# Altium schematic sheet Temperature_Sensor_Schematic.SchDoc
size A; SheetNumber: 1; SheetTotal: 1
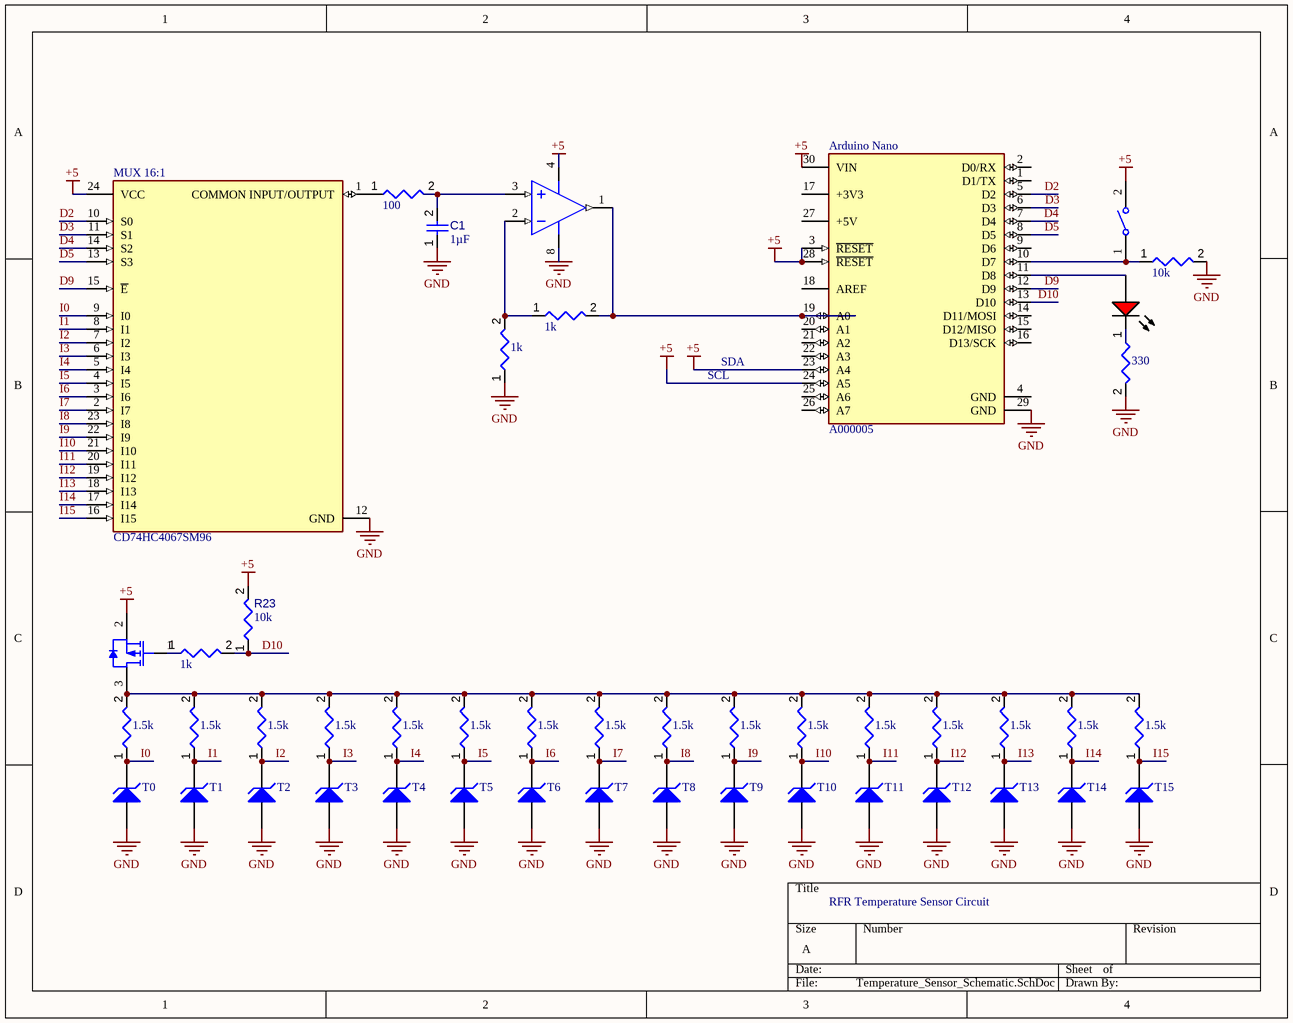
[diagram p0: Temperature_Sensor_Schematic.SchDoc]

## Parts
5  value 1.5k  [RESC0805(2012)_L]  (hidden comment: 1KR5J)
8  value 1.5k  [RESC0805(2012)_L]  (hidden comment: 1KR5J)
9R?  value 1.5k  [RESC0805(2012)_L]  (hidden comment: 1KR5J)
11  value 1.5k  [RESC0805(2012)_L]  (hidden comment: 1KR5J)
12  value 1.5k  [RESC0805(2012)_L]  (hidden comment: 1KR5J)
15R?  value 1.5k  [RESC0805(2012)_L]  (hidden comment: 1KR5J)
Arduino_Nano  A000005  [FP-A000005-MFG]
C1  value 1µF  [CAPC0603(1608)100_L]  (hidden comment: Capacitor 1µF +/-40% 50V 0603)
DS?  LTST-C190KRKT  [LTST-C191KRKT_V]  (value not drawn)
MUX_16:1  CD74HC4067SM96  [FP-DB0024A-IPC_C]
OP-AMP1  MCP6002-I/P  [PDIP300-P8]  (value not drawn)  (part A of 2)
Q?  AO3401A  [AO-SOT-23-3L_V]  (value not drawn)
R1  value 1.5k  [RESC0805(2012)_L]  (hidden comment: 1KR5J)
R2  value 1.5k  [RESC0805(2012)_L]  (hidden comment: 1KR5J)
R3  value 1.5k  [RESC0805(2012)_L]  (hidden comment: 1KR5J)
R4  value 1.5k  [RESC0805(2012)_L]  (hidden comment: 1KR5J)
R6  value 1.5k  [RESC0805(2012)_L]  (hidden comment: 1KR5J)
R7  value 1.5k  [RESC0805(2012)_L]  (hidden comment: 1KR5J)
R10  value 1.5k  [RESC0805(2012)_L]  (hidden comment: 1KR5J)
R13  value 1.5k  [RESC0805(2012)_L]  (hidden comment: 1KR5J)
R14  value 1.5k  [RESC0805(2012)_L]  (hidden comment: 1KR5J)
R16  value 1.5k  [RESC0805(2012)_L]  (hidden comment: 1KR5J)
R17  value 1k  [RESC0805(2012)_L]  (hidden comment: 1KR5J)
R18  value 100  [RESC0402(1005)_L]  (hidden comment: 100R2F)
R19  value 1k  [RESC0805(2012)_L]  (hidden comment: 1KR5J)
R20  value 1k  [RESC0805(2012)_L]  (hidden comment: 1KR5J)
R21  value 330  [RESC0402(1005)_L]  (hidden comment: 330R2J)
R22  value 10k  [RESC0402(1005)_L]  (hidden comment: 10KR2F)
R23  value 10k  [RESC0402(1005)_L]  (hidden comment: 10KR2F)
SW?  B3U-3000P  [OMRON-B3U-3000P_V]  (value not drawn)
T0  VTC5A  [FAIR-DO-35-2]  (value not drawn)
T1  VTC5A  [FAIR-DO-35-2]  (value not drawn)
T2  VTC5A  [FAIR-DO-35-2]  (value not drawn)
T3  VTC5A  [FAIR-DO-35-2]  (value not drawn)
T4  VTC5A  [FAIR-DO-35-2]  (value not drawn)
T5  VTC5A  [FAIR-DO-35-2]  (value not drawn)
T6  VTC5A  [FAIR-DO-35-2]  (value not drawn)
T7  VTC5A  [FAIR-DO-35-2]  (value not drawn)
T8  VTC5A  [FAIR-DO-35-2]  (value not drawn)
T9  VTC5A  [FAIR-DO-35-2]  (value not drawn)
T10  VTC5A  [FAIR-DO-35-2]  (value not drawn)
T11  VTC5A  [FAIR-DO-35-2]  (value not drawn)
T12  VTC5A  [FAIR-DO-35-2]  (value not drawn)
T13  VTC5A  [FAIR-DO-35-2]  (value not drawn)
T14  VTC5A  [FAIR-DO-35-2]  (value not drawn)
T15  VTC5A  [FAIR-DO-35-2]  (value not drawn)

## Nets
+5: Arduino_Nano.3(~{RESET}) Arduino_Nano.23(A4) Arduino_Nano.24(A5) Arduino_Nano.28(~{RESET}) Arduino_Nano.30(VIN) MUX_16:1.24(VCC) OP-AMP1.4(VSS) Q?.2(SOURCE) R23.2 SW?.2
GND: Arduino_Nano.29(GND) C1.1 MUX_16:1.12(GND) OP-AMP1.8(VDD) R19.1 R21.2 R22.2 T0.1(A) T1.1(A) T2.1(A) T3.1(A) T4.1(A) T5.1(A) T6.1(A) T7.1(A) T8.1(A) T9.1(A) T10.1(A) T11.1(A) T12.1(A) T13.1(A) T14.1(A) T15.1(A)
D2: Arduino_Nano.5(D2) MUX_16:1.10(S0)
D3: Arduino_Nano.6(D3) MUX_16:1.11(S1)
D4: Arduino_Nano.7(D4) MUX_16:1.14(S2)
D5: Arduino_Nano.8(D5) MUX_16:1.13(S3)
D9: Arduino_Nano.12(D9) MUX_16:1.15(~{E})
D10: Arduino_Nano.13(D10) R17.2 R23.1
I0: MUX_16:1.9(I0) R1.1 T0.2(K)
I1: MUX_16:1.8(I1) R2.1 T1.2(K)
I2: MUX_16:1.7(I2) R3.1 T2.2(K)
I3: MUX_16:1.6(I3) R4.1 T3.2(K)
I4: 5.1 MUX_16:1.5(I4) T4.2(K)
I5: MUX_16:1.4(I5) R6.1 T5.2(K)
I6: MUX_16:1.3(I6) R7.1 T6.2(K)
I7: 8.1 MUX_16:1.2(I7) T7.2(K)
I8: 9R?.1 MUX_16:1.23(I8) T8.2(K)
I9: MUX_16:1.22(I9) R10.1 T9.2(K)
I10: 11.1 MUX_16:1.21(I10) T10.2(K)
I11: 12.1 MUX_16:1.20(I11) T11.2(K)
I12: MUX_16:1.19(I12) R13.1 T12.2(K)
I13: MUX_16:1.18(I13) R14.1 T13.2(K)
I14: 15R?.1 MUX_16:1.17(I14) T14.2(K)
I15: MUX_16:1.16(I15) R16.1 T15.2(K)
Net5_2: 5.2 8.2 9R?.2 11.2 12.2 15R?.2 Q?.3(DRAIN) R1.2 R2.2 R3.2 R4.2 R6.2 R7.2 R10.2 R13.2 R14.2 R16.2
NetArduino_Nano_10: Arduino_Nano.10(D7) R22.1 SW?.1
NetArduino_Nano_11: Arduino_Nano.11(D8) DS?.1(A)
NetArduino_Nano_19: Arduino_Nano.19(A0) OP-AMP1.1(VOUTA) R20.2
NetC1_2: C1.2 OP-AMP1.3(VINA+) R18.2
NetDS?_2: DS?.2(K) R21.1
NetMUX_16:1_1: MUX_16:1.1(COMMON_INPUT/OUTPUT) R18.1
NetOP-AMP1_2: OP-AMP1.2(VINA-) R19.2 R20.1
NetQ?_1: Q?.1(GATE) R17.1

Not connected (* = marked no-connect by the designer): Arduino_Nano 1(D1/TX) 2(D0/RX) 4(GND) 9(D6) 14(D11/MOSI) 15(D12/MISO) 16(D13/SCK) 17(+3V3) 18(AREF) 20(A1) 21(A2) 22(A3) 25(A6) 26(A7) 27(+5V)

## Notes on the sheet
- SDA
- SCL
- RFR Temperature Sensor Circuit

## Library data of the parts
5 8 9R? 11 12 15R? R1-R4 R6 R7 R10 R13 R14 R16 R17 R19 R20 = CMP-009-00076-2: 1K 0.125W 5% 0805 (2012 Metric)  SMD; Power: 125mW; Pins: 2; Mounting Technology: SMT; Tolerance: 5%; Case/Package: 0805
Arduino_Nano = CMP-189986-000002-1: ARDUINO NANO ATMEGA328 EVAL BRD; Number of Bits: 8; Evaluation Kit: Yes; Operating Supply Voltage: 12V; Interface: I2C; Data Bus Width: 8b; Core Architecture: AVR; Packaging: Bulk; Length: 7inch; Package Quantity: 50; Width: 5inch; REACH SVHC: No SVHC; Weight: 0.358383oz; Series: AVR® ATmega; Height: 0.25inch
C1 = CMP-001-00078-4: Chip Capacitor, 1µF +/-40%, 50V, 0603, Thickness 1 mm; Tolerance: 10%; Case/Package: 0603; Pins: 2; Max Operating Temperature: 85°C; Voltage Rating: 50V; Mounting Technology: SMT; Min Operating Temperature: -55°C
DS? = CMP-007-00024-2: LED Uni-Color Red, 62.5 mW, 25 mA, -30 to 85 degC, 2-Pin SMD, RoHS, Tape and Reel; Manufacturer: Lite-On; Power: 75mW; Forward Voltage: 2V; Luminous Intensity: 54mcd; Lens Style: Diffused; Viewing Angle: 130degrees; Forward Current: 20mA; Manufacturer URL: http://www.us.liteon.com/; Case/Package: 0603; Datasheet Version: Rev. F, 05/2013; Package Reference: C191KRKT; Datasheet URL: http://optoelectronics.liteon.com/upload/download/DS-22-99-0151/S_110_LTST-C190KRKT.pdf; Package Description: 2-Pin Surface Mount Device, Body 1.6 x 0.8 mm; Nominal Vf: 2V; Packaging: TapeandReel; RoHS Compliant: True; Pins: 2; Illumination Colour: Red; Colour: Red; Mounting Technology: SM; Package Quantity: 3000; Min Operating Temperature: -55°C; Max Operating Temperature: 85°C
MUX_16:1 = CMP-04892-000038-1: IC MUX/DEMUX 1X16 24SSOP; Supply Type: Single; High Level Output Current: 25mA; Min Supply Voltage: 2V; Number of Circuits: 16; Max Supply Voltage: 6V; Number of Channels: 1; Turn-On Delay Time: 300ns; Max Supply Current: 8uA; Bandwidth: 89MHz; Turn-Off Delay Time: 290ns; Propagation Delay: 75ns; Logic Function: Multiplexer; On-State Resistance: 160R; Polarity: Non-Inverting; Width: 5.3mm; Case/Package: SSOP; Max Operating Temperature: 125°C; Mount: Surface Mount; Min Operating Temperature: -55°C; REACH SVHC: No SVHC; Contact Plating: Gold; Max Output Current: 25mA; Weight: 0.006081oz; Height: 1.95mm; Package Quantity: 2000; Length: 8.2mm; Lead Free: Lead Free; Operating Supply Current: 8uA; Packaging: Tape and Reel; Series: 74HC; Low Level Output Current: 25mA; Number of Outputs: 1; Termination: SMD/SMT; Number of Inputs: 16; Number of Bits: 16; Radiation Hardening: No; Number of Pins: 24
OP-AMP1 = CMP-0187-00119-3: None; Max Frequency: 1kHz; Operating Supply Current: 100uA; Amplifier Type: GENERAL PURPOSE; Number of Channels: 2; Power Supply Rejection Ratio (PSRR): 86dB; Max Input Voltage: 6V; Bandwidth: 1MHz; Voltage Gain: 112dB; Input Bias Current: 1pA; Slew Rate-Nom: 0.6V/µs; Output Current: 23mA; Input Offset Voltage-Max: 4.5mV; Common Mode Rejection Ratio: 60dB; Min Input Voltage: 1.8V; Operating Supply Voltage: 5.5V; Height: 0.195inch; Number of Circuits: 2; REACH SVHC: No SVHC; Max Supply Voltage: 6V; Supply Current: 100uA; Gain Bandwidth Product: 1MHz; Radiation Hardening: No; Mount: Through Hole; Length: 0.4inch; Number of Pins: 8; Min Operating Temperature: -40°C; Case/Package: PDIP; Number of Amplifiers: 2; RoHS Compliant: Yes; Lead Free: Lead Free; Number of Elements: 2; Technology: CMOS; Width: 0.28inch; Slew Rate: 0.6V/µs; Packaging: Rail/Tube; Output Current per Channel: 23mA; Max Operating Temperature: 85°C; Nominal Supply Current: 100uA; Min Supply Voltage: 1.8V; Input Offset Voltage (Vos): 4.5mV; Unity Gain Bandwidth Product: 1MHz; Package Quantity: 60
Q? = CMP-2000-05778-1: P-Channel MOSFET, 30 V, 4 A, -55 to 150 degC, 3-Pin SOT-23-3L, RoHS, Tape and Reel; Manufacturer: Alpha and Omega; Output Power (Max): NotRequiredW; Power Dissipation: 1.4W; Rad Hardened: No; Drain Efficiency: NotRequired%; Drain-Source On-Volt: 30V; Noise Figure: NotRequireddB; Frequency (Max): NotRequiredMHz; Number of  Elements: 1; Gate-Source Voltage (Max): ?12V; Drain Current (Max): 4A; Channel Mode: Enhancement; Drain-Source On-Res: 0.044ohm; Type: PowerMOSFET; Polarity: P; Package URL: http://www.aosmd.com/res/packaging_information/SOT-23-3L.pdf; Datasheet URL: http://www.aosmd.com/res/data_sheets/AO3401A.pdf; Package Type: SOT-23; Package Description: 3-Pin Small Outline Transistor, Body 2.95 x 1.6 mm, Pitch 0.95 mm; Mounting: SurfaceMount; Manufacturer URL: http://www.aosmd.com/; Continuous Drain Current: 4A; Package Reference: SOT-23-3L; Mounting Technology: SurfaceMount; Operating Temperature Classification: Military; Power Gain: NotRequireddB; Datasheet Version: Rev. 3, 03/2011; Operating Temp Range: -55Cto150C; Pin Count: 3
R18 = CMP-009-00065-2: 100R 0.063W 1% 0402 (1005 Metric)  SMD; Power: 63mW; Tolerance: 1%; Case/Package: 0402; Pins: 2; Mounting Technology: SMT
R21 = CMP-009-00095-2: 330R 0.063W 5% 0402 (1005 Metric)  SMD; Power: 63mW; Tolerance: 5%; Mounting Technology: SMT; Case/Package: 0402; Pins: 2
R22 R23 = CMP-009-00066-2: 10K 0.063W 1% 0402 (1005 Metric)  SMD; Power: 63mW; Case/Package: 0402; Mounting Technology: SMT; Pins: 2; Tolerance: 1%
SW? = CMP-011-00005-2: Tactile Switch, SPST-NO, 0.05 A, 12 V, -25 to 70 degC, 2-Pin SMD, RoHS, Tape and Reel; Manufacturer: Omron Electronic Components; Operating Force: 162gf; Voltage Rating (DC): 12V; Current Rating: 50mA; IP Rating: IP40; Throw Configuration: SPST; Max Contact Resistance: 100mohm; RoHS Compliant: True; Contact Current Rating: 50mA; Manufacturer URL: http://www.omron.com/; Packaging: TapeandReel; Max Voltage Rating (DC): 12V; Contact Material: Silver; Datasheet Version: Jan-15; Package Reference: B3U-3000P; Package Description: 2-Pin Surface Mount Device, Body 4 x 3.2 mm; Min Operating Temperature: -25°C; Package Quantity: 4000; Max Operating Temperature: 70°C; Max Current Rating: 50mA; Voltage Rating: 12V; Case/Package: B3U-3000P; Mounting Technology: SM; Datasheet URL: https://www.omron.com/ecb/products/pdf/en-b3u.pdf
T0-T15 = CMP-004-00021-2: Zener Diode, 3.6 V, 5 mA, -65 to 200 degC, 2-Pin DO-35, RoHS, Bulk; Manufacturer: Fairchild Semiconductor; Tolerance: 6%; Power: 500mW; Forward Voltage: 1.5V; Impedance: 90Ohm; Package Quantity: 1000; Min Operating Temperature: -65°C; Datasheet Version: Rev. C1, 07/2007; Max Operating Temperature: 200°C; Mounting Technology: TH; Package Description: 2-Pin Through Hole Diode, Dia 1.72 mm, Body Length 3.805 mm; RoHS Compliant: True; Manufacturer URL: https://www.fairchildsemi.com/; Package Reference: DO-35-2; Case/Package: DO-35-2; Datasheet URL: https://www.fairchildsemi.com/datasheets/BZ/BZX79C3V6.pdf; Package URL: https://www.fairchildsemi.com/package-drawings/DO/DO35A.pdf; Pins: 2; Packaging: Bulk